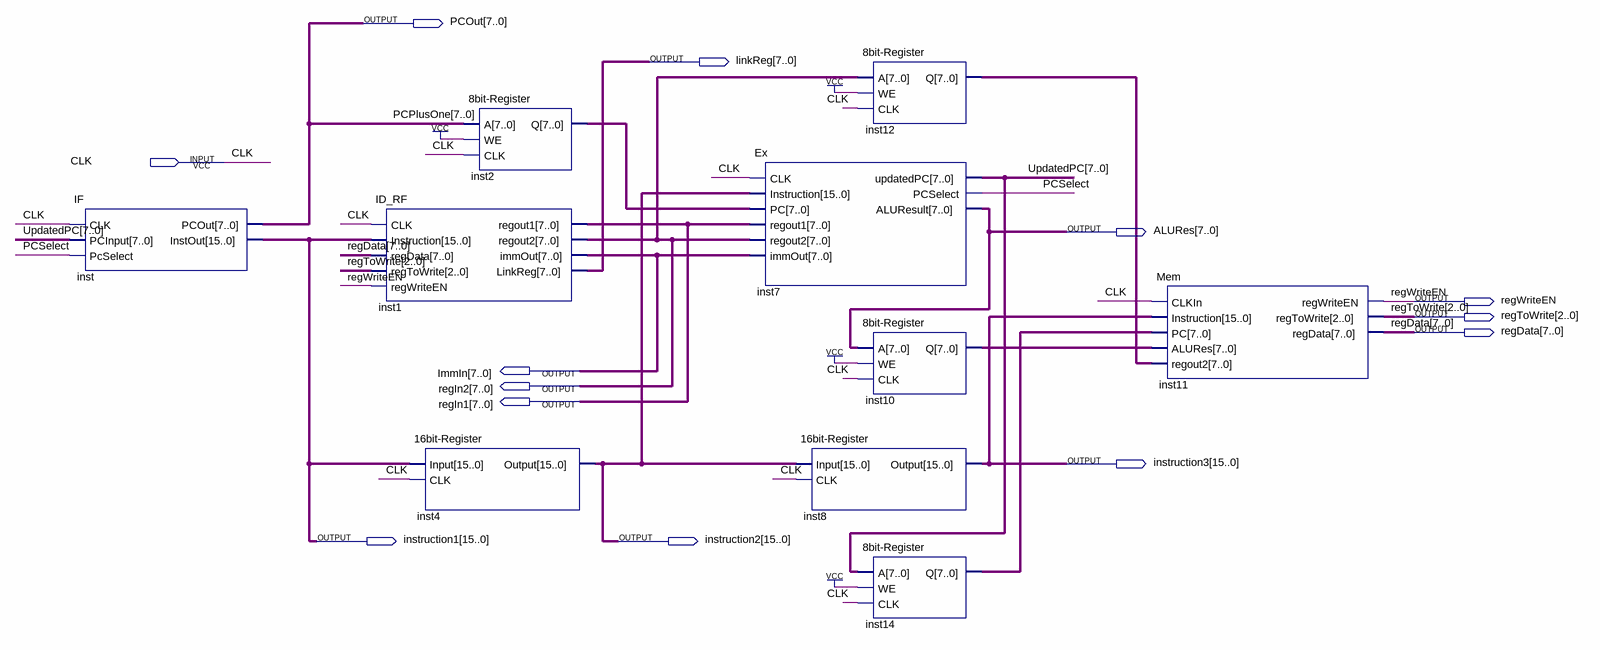
[diagram p0: schematic sheet]
// Quartus schematic Pipeline.bdf as structural Verilog: 10 symbols, 13 pins
module Pipeline (
  input  CLK,
  output [7:0] PCOut,
  output [7:0] linkReg,
  output [7:0] ALURes,
  output regWriteEN,
  output [2:0] regToWrite,
  output [7:0] regData,
  output [7:0] ImmIn,
  output [7:0] regIn2,
  output [7:0] regIn1,
  output [15:0] instruction3,
  output [15:0] instruction1,
  output [15:0] instruction2
);

  wire PCSelect;
  wire [7:0] inst2_q, inst10_q, inst12_q, inst14_q, UpdatedPC;

  IF inst (.CLK(CLK), .PCInput(UpdatedPC), .PcSelect(PCSelect), .PCOut(PCOut), .InstOut(instruction1));
  ID_RF inst1 (
    .CLK(CLK), .Instruction(instruction1), .regData(regData), .regToWrite(regToWrite),
    .regWriteEN(regWriteEN), .regout1(regIn1), .regout2(regIn2), .immOut(ImmIn), .LinkReg(linkReg));
  \16bit-Register  inst4 (.Input(instruction1), .CLK(CLK), .Output(instruction2));
  \8bit-Register  inst2 (.A(PCOut), .WE(1'b1), .CLK(CLK), .Q(inst2_q));
  Ex inst7 (
    .CLK(CLK), .Instruction(instruction2), .PC(inst2_q), .regout1(regIn1), .regout2(regIn2), .immOut(ImmIn),
    .updatedPC(UpdatedPC), .PCSelect(PCSelect), .ALUResult(ALURes));
  \16bit-Register  inst8 (.Input(instruction2), .CLK(CLK), .Output(instruction3));
  \8bit-Register  inst12 (.A(regIn2), .WE(1'b1), .CLK(CLK), .Q(inst12_q));
  \8bit-Register  inst10 (.A(ALURes), .WE(1'b1), .CLK(CLK), .Q(inst10_q));
  \8bit-Register  inst14 (.A(UpdatedPC), .WE(1'b1), .CLK(CLK), .Q(inst14_q));
  Mem inst11 (
    .CLKIn(CLK), .Instruction(instruction3), .PC(inst14_q), .ALURes(inst10_q), .regout2(inst12_q),
    .regWriteEN(regWriteEN), .regToWrite(regToWrite), .regData(regData));

  // Other names for the same wires on the sheet: PCPlusOne[7:0] = PCOut
endmodule
